# Altium project OPA4377.PrjPCB
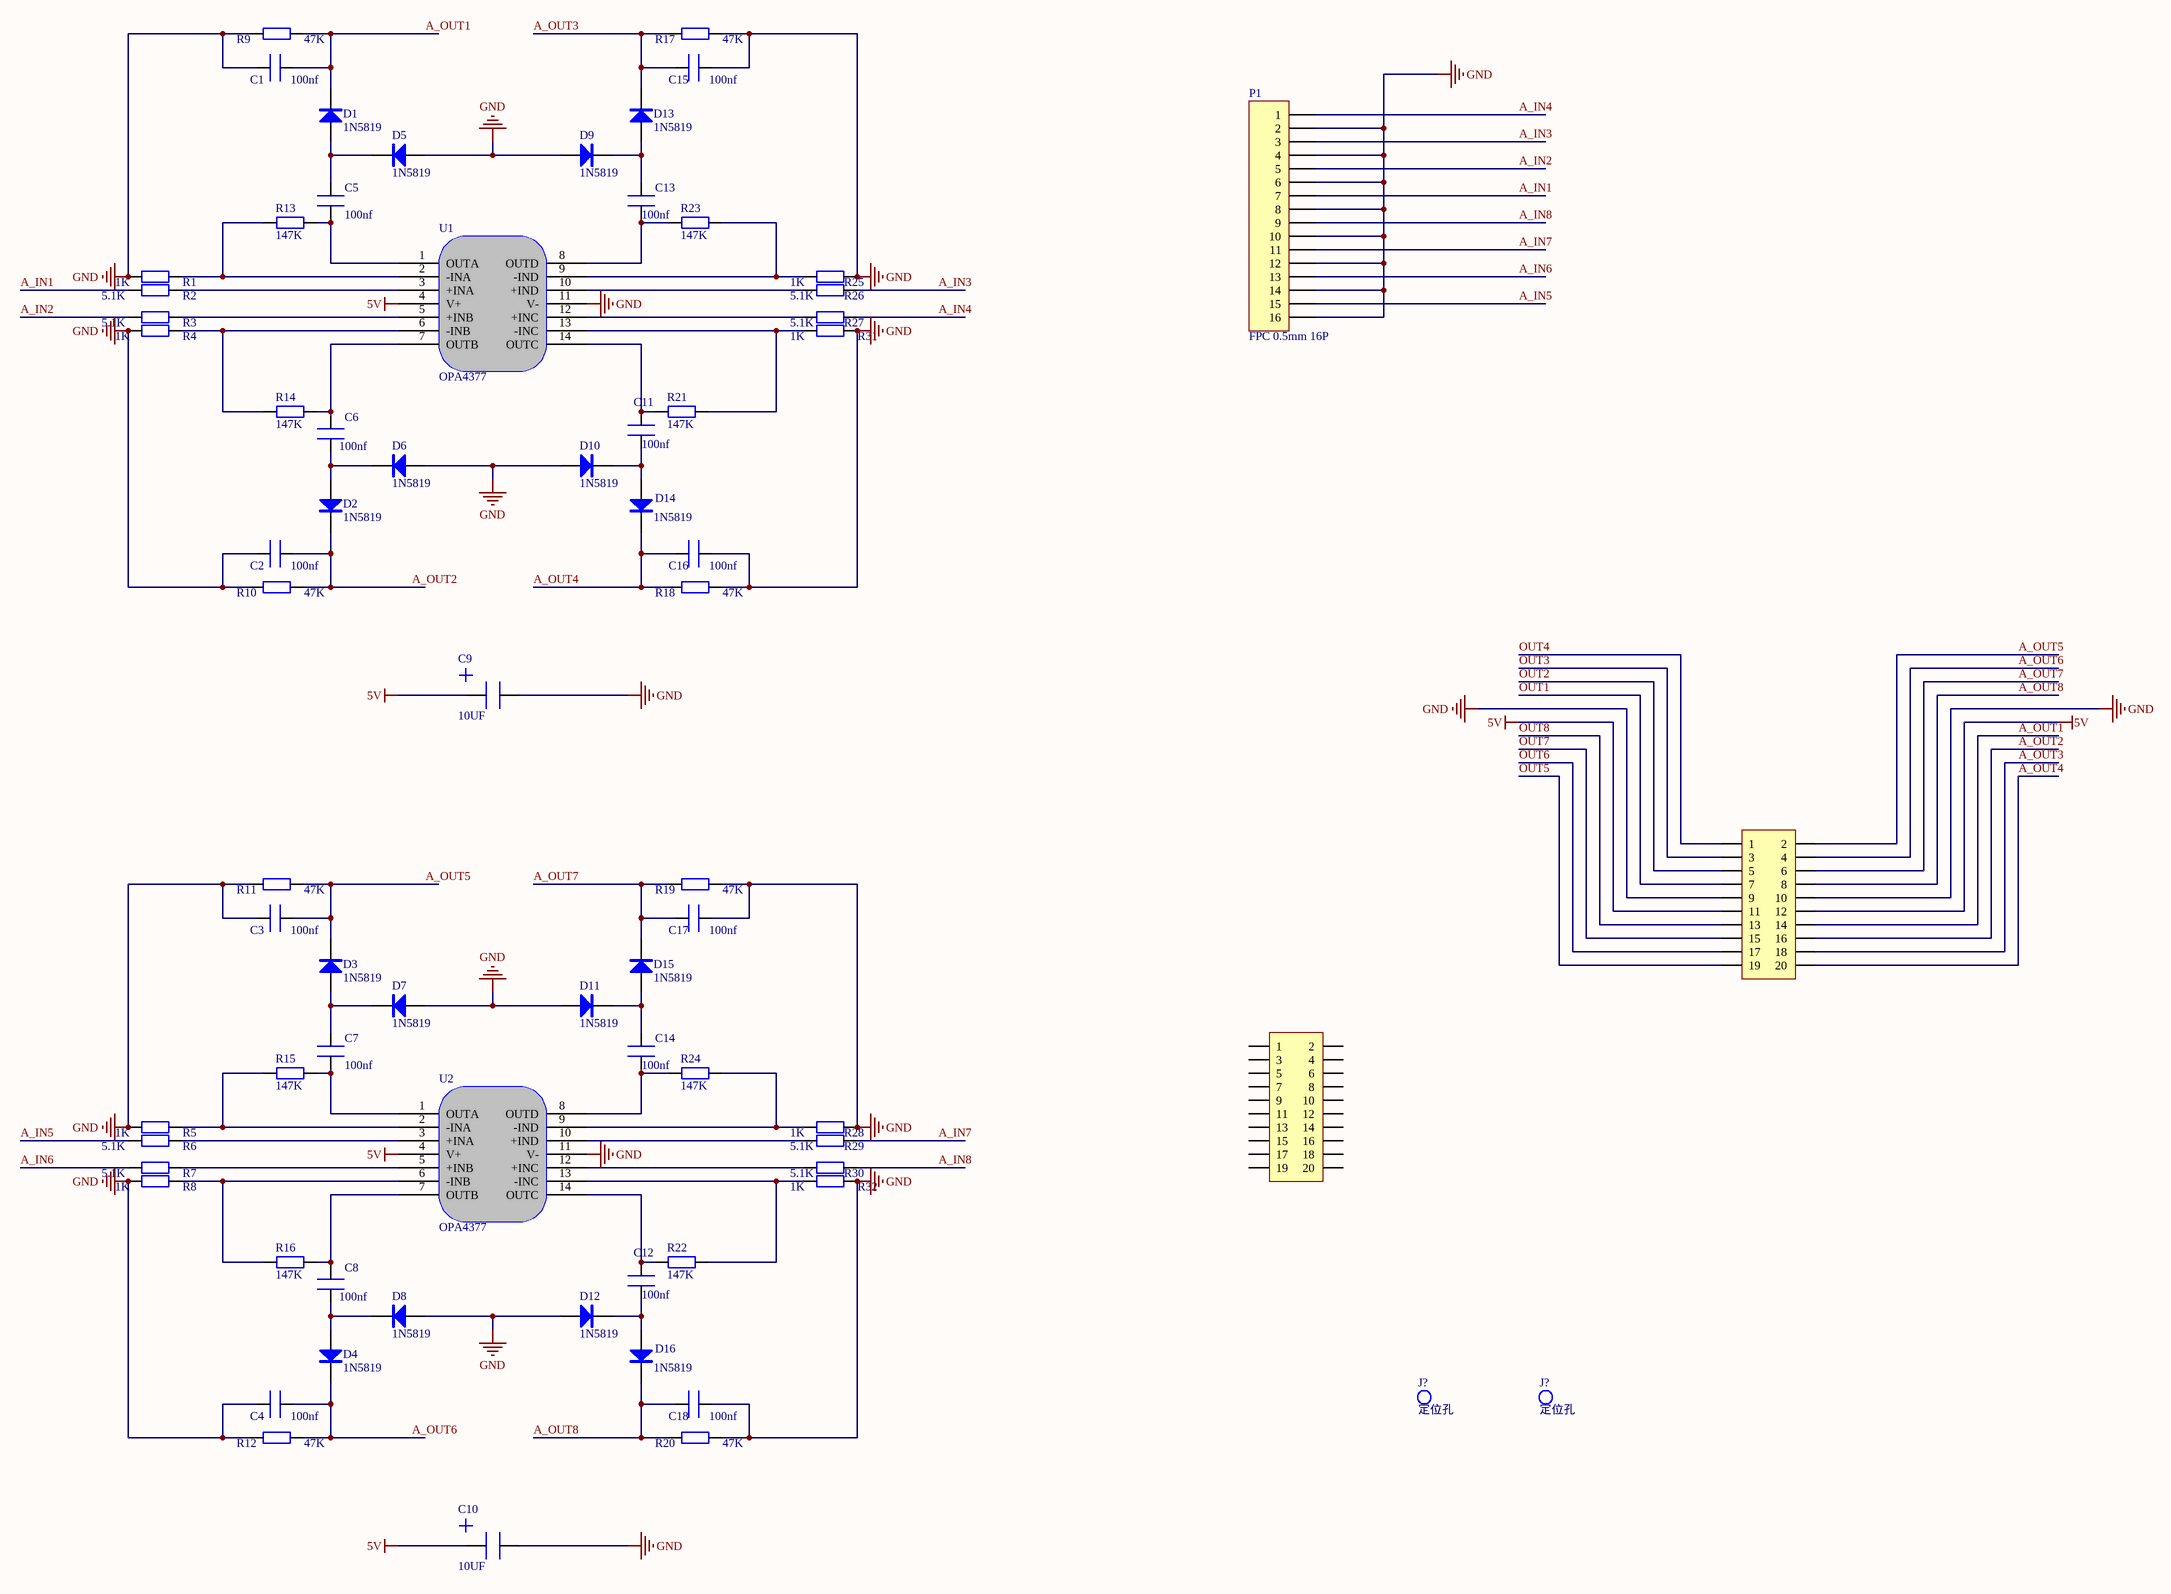
[diagram p0: OPA4377.SchDoc]
2 sheets, 142 parts. Net scope: global (net labels, ports and power ports of the same name join across sheets).
Board files: OPA4377.PcbDoc, OPA4377 - 副本.PcbDoc
Sheets:
  OPA4377.SchDoc
  OPA4377 - 副本.SchDoc

## Sheet OPA4377.SchDoc
size A2

### Parts
(Parts that share a designator on the sheet are numbered #1, #2 ... from top to bottom, then left to right.)
C1  100nf  [C0603]
C2  100nf  [C0603]
C3  100nf  [C0603]
C4  100nf  [C0603]
C5  100nf  [C0603]
C6  100nf  [C0603]
C7  100nf  [C0603]
C8  100nf  [C0603]
C9  10UF  [0805 电容 C3]
C10  10UF  [0805 电容 C3]
C11  100nf  [C0603]
C12  100nf  [C0603]
C13  100nf  [C0603]
C14  100nf  [C0603]
C15  100nf  [C0603]
C16  100nf  [C0603]
C17  100nf  [C0603]
C18  100nf  [C0603]
D1  1N5819  [SOD-523]
D2  1N5819  [SOD-523]
D3  1N5819  [SOD-523]
D4  1N5819  [SOD-523]
D5  1N5819  [SOD-523]
D6  1N5819  [SOD-523]
D7  1N5819  [SOD-523]
D8  1N5819  [SOD-523]
D9  1N5819  [SOD-523]
D10  1N5819  [SOD-523]
D11  1N5819  [SOD-523]
D12  1N5819  [SOD-523]
D13  1N5819  [SOD-523]
D14  1N5819  [SOD-523]
D15  1N5819  [SOD-523]
D16  1N5819  [SOD-523]
J?#1  定位孔  [MTGP720H320V6P - duplicate]
J?#2  定位孔  [MTGP720H320V6P - duplicate]
JP?#1  Header 2X10  [HDR2.54-LI-2x10P]  (value not drawn)
JP?#2  Header 2X10  [HDR2.54-LI-2x10P]  (value not drawn)
P1  FPC 0.5mm 16P  [FPC0.5 2H-WS-16P]
R1  1K  [R0603]
R2  5.1K  [R0603]
R3  5.1K  [R0603]
R4  1K  [R0603]
R5  1K  [R0603]
R6  5.1K  [R0603]
R7  5.1K  [R0603]
R8  1K  [R0603]
R9  47K  [R0603]
R10  47K  [R0603]
R11  47K  [R0603]
R12  47K  [R0603]
R13  147K  [R0603]
R14  147K  [R0603]
R15  147K  [R0603]
R16  147K  [R0603]
R17  47K  [R0603]
R18  47K  [R0603]
R19  47K  [R0603]
R20  47K  [R0603]
R21  147K  [R0603]
R22  147K  [R0603]
R23  147K  [R0603]
R24  147K  [R0603]
R25  1K  [R0603]
R26  5.1K  [R0603]
R27  5.1K  [R0603]
R28  1K  [R0603]
R29  5.1K  [R0603]
R30  5.1K  [R0603]
R31  1K  [R0603]
R32  1K  [R0603]
U1  OPA4377  [TSSOP-14]
U2  OPA4377  [TSSOP-14]

### Nets
5V: C9.1 C10.1 JP?#1.11 JP?#1.12 U1.4(V+) U2.4(V+)
GND: C1.2 C2.2 C3.2 C4.2 C9.2 C10.2 C15.1 C16.1 C17.1 C18.1 D5.1(A) D6.1(A) D7.1(A) D8.1(A) D9.1(A) D10.1(A) D11.1(A) D12.1(A) JP?#1.9 JP?#1.10 P1.2 P1.4 P1.6 P1.8 P1.10 P1.12 P1.14 P1.16 R1.1 R4.1 R5.1 R8.1 R9.1 R10.1 R11.1 R12.1 R17.2 R18.2 R19.2 R20.2 R25.2 R28.2 R31.2 R32.2 U1.11(V-) U2.11(V-)
A_IN1: P1.7 R2.1
A_IN2: P1.5 R3.1
A_IN3: P1.3 R26.2
A_IN4: P1.1 R27.2
A_IN5: P1.15 R6.1
A_IN6: P1.13 R7.1
A_IN7: P1.11 R29.2
A_IN8: P1.9 R30.2
A_OUT1: C1.1 D1.2(K) JP?#1.14 R9.2
A_OUT2: C2.1 D2.2(K) JP?#1.16 R10.2
A_OUT3: C15.2 D13.2(K) JP?#1.18 R17.1
A_OUT4: C16.2 D14.2(K) JP?#1.20 R18.1
A_OUT5: C3.1 D3.2(K) JP?#1.2 R11.2
A_OUT6: C4.1 D4.2(K) JP?#1.4 R12.2
A_OUT7: C17.2 D15.2(K) JP?#1.6 R19.1
A_OUT8: C18.2 D16.2(K) JP?#1.8 R20.1
OUT1: JP?#1.7
OUT2: JP?#1.5
OUT3: JP?#1.3
OUT4: JP?#1.1
OUT5: JP?#1.19
OUT6: JP?#1.17
OUT7: JP?#1.15
OUT8: JP?#1.13
NetC5_1: C5.1 R13.2 U1.1(OUTA)
NetC5_2: C5.2 D1.1(A) D5.2(K)
NetC6_1: C6.1 R14.2 U1.7(OUTB)
NetC6_2: C6.2 D2.1(A) D6.2(K)
NetC7_1: C7.1 R15.2 U2.1(OUTA)
NetC7_2: C7.2 D3.1(A) D7.2(K)
NetC8_1: C8.1 R16.2 U2.7(OUTB)
NetC8_2: C8.2 D4.1(A) D8.2(K)
NetC11_1: C11.1 D10.2(K) D14.1(A)
NetC11_2: C11.2 R21.1 U1.14(OUTC)
NetC12_1: C12.1 D12.2(K) D16.1(A)
NetC12_2: C12.2 R22.1 U2.14(OUTC)
NetC13_1: C13.1 R23.1 U1.8(OUTD)
NetC13_2: C13.2 D9.2(K) D13.1(A)
NetC14_1: C14.1 R24.1 U2.8(OUTD)
NetC14_2: C14.2 D11.2(K) D15.1(A)
NetR1_2: R1.2 R13.1 U1.2(-INA)
NetR2_2: R2.2 U1.3(+INA)
NetR3_2: R3.2 U1.5(+INB)
NetR4_2: R4.2 R14.1 U1.6(-INB)
NetR5_2: R5.2 R15.1 U2.2(-INA)
NetR6_2: R6.2 U2.3(+INA)
NetR7_2: R7.2 U2.5(+INB)
NetR8_2: R8.2 R16.1 U2.6(-INB)
NetR21_2: R21.2 R31.1 U1.13(-INC)
NetR22_2: R22.2 R32.1 U2.13(-INC)
NetR23_2: R23.2 R25.1 U1.9(-IND)
NetR24_2: R24.2 R28.1 U2.9(-IND)
NetR26_1: R26.1 U1.10(+IND)
NetR27_1: R27.1 U1.12(+INC)
NetR29_1: R29.1 U2.10(+IND)
NetR30_1: R30.1 U2.12(+INC)

Not connected (* = marked no-connect by the designer): JP?#2 1 2 3 4 5 6 7 8 9 10 11 12 13 14 15 16 17 18 19 20

### Library data of the parts
C1-C8 C11-C18 = 100nf  0603 C
C9 C10 = TAN C
D1-D16 = 1N5819: 肖特基二极管; 淘宝ID: 黄晶宝石; 属性: 40V/2A; BOM名称: 肖特基二极管; 欢迎光临: https://shop463601444.taobao.com
JP?#1 JP?#2 = Header 10X2: 10*2P接插件; 版权归属: 源创客; BOM名称: 10*2P接插件; 学习资源: www.ooocke.com
P1 = Header 16: Header, 16-Pin; LatestRevisionDate: 17-Jul-2002; LatestRevisionNote: Re-released for DXP Platform.; Publisher: Altium Limited
R1 R4 R5 R8 R25 R28 R31 R32 = 1K 0603 R
R2 R3 R6 R7 R26 R27 R29 R30 = 5.1K 0603 R
R9-R24 = 47K 0603 R

## Sheet OPA4377 - 副本.SchDoc
size A2
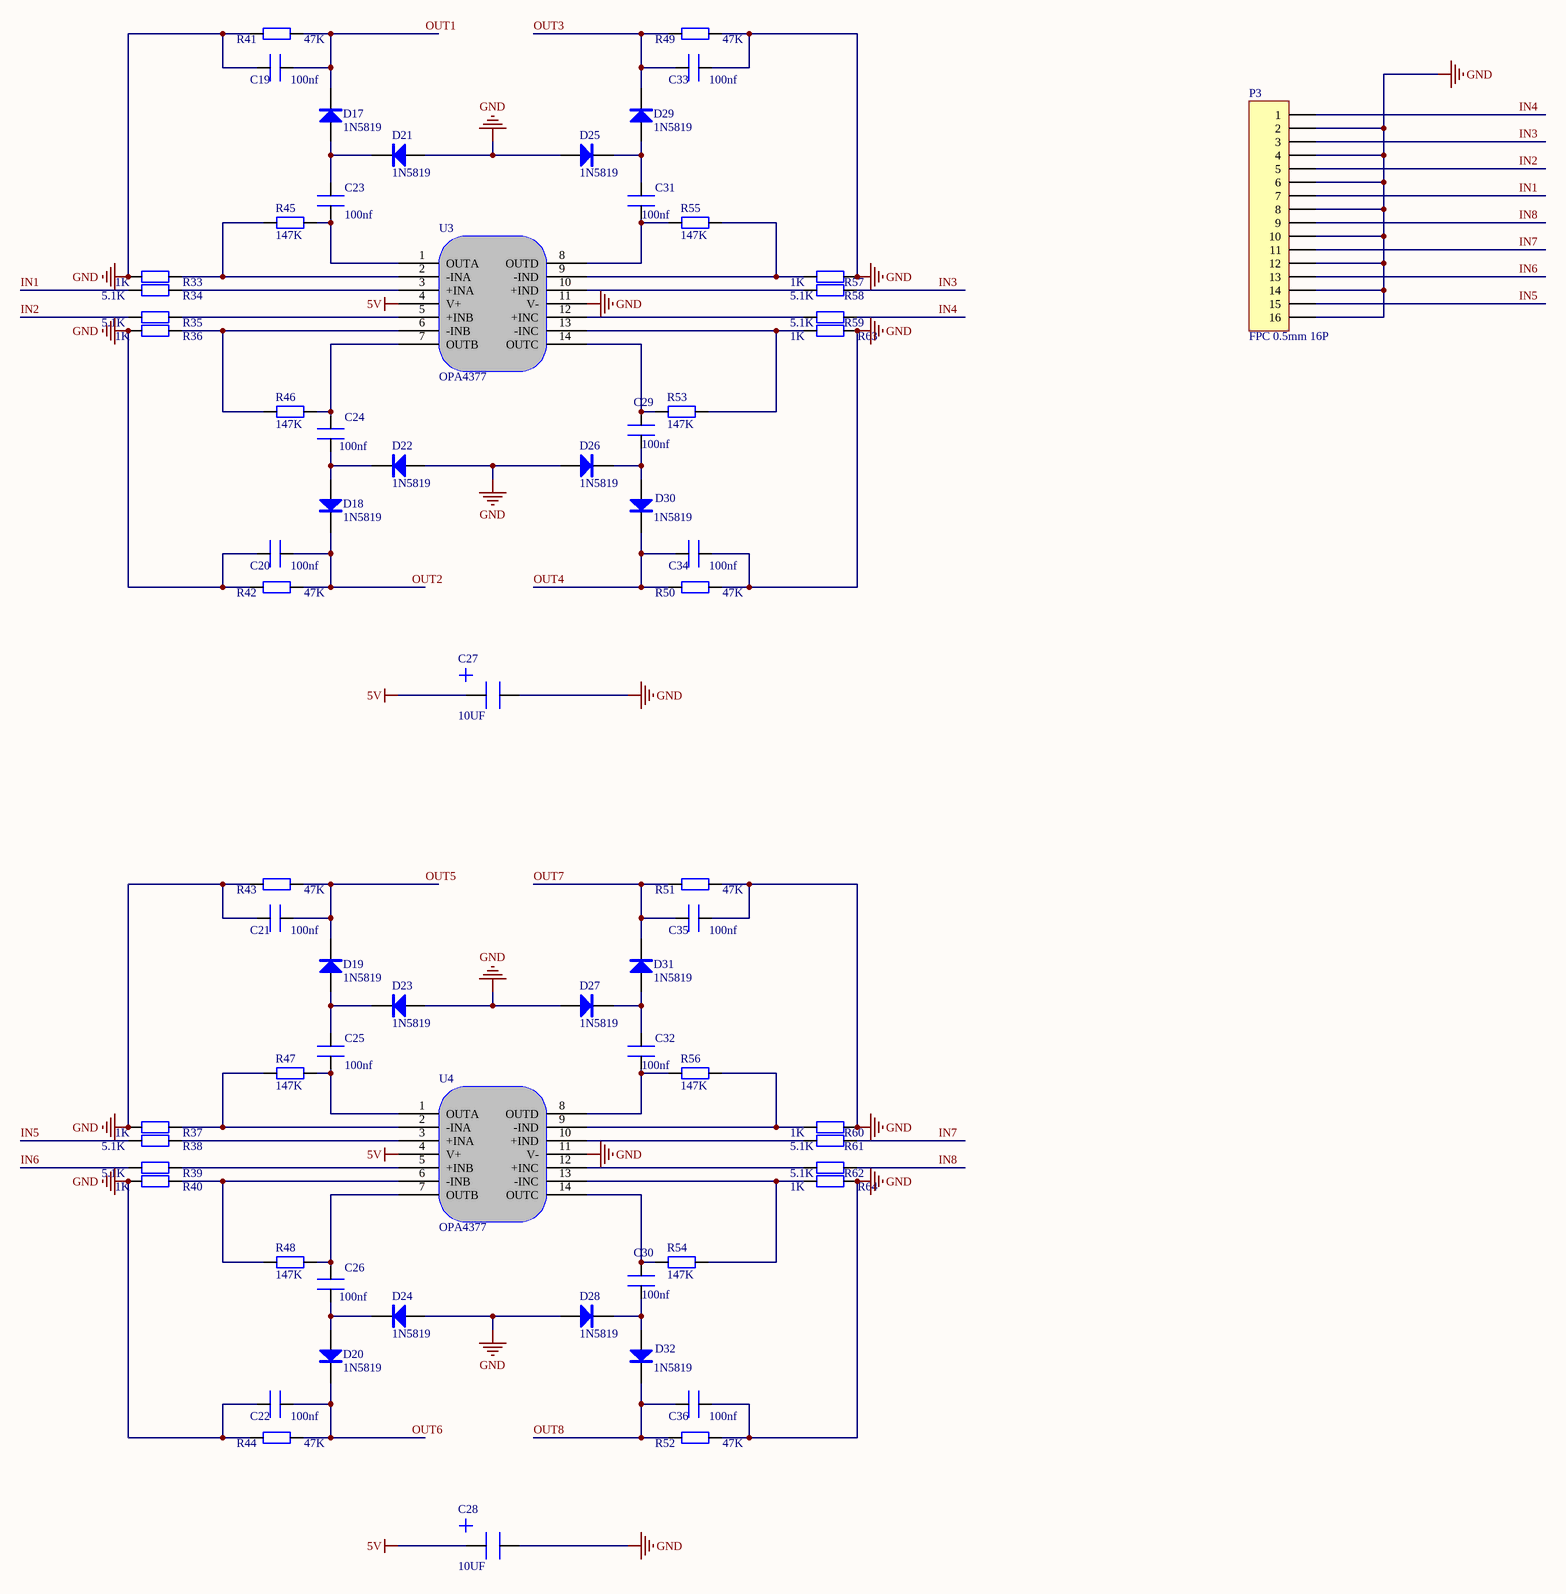
[diagram p1: OPA4377 - 副本.SchDoc]

### Parts
C19  100nf  [C0603]
C20  100nf  [C0603]
C21  100nf  [C0603]
C22  100nf  [C0603]
C23  100nf  [C0603]
C24  100nf  [C0603]
C25  100nf  [C0603]
C26  100nf  [C0603]
C27  10UF  [0805 电容 C3]
C28  10UF  [0805 电容 C3]
C29  100nf  [C0603]
C30  100nf  [C0603]
C31  100nf  [C0603]
C32  100nf  [C0603]
C33  100nf  [C0603]
C34  100nf  [C0603]
C35  100nf  [C0603]
C36  100nf  [C0603]
D17  1N5819  [SOD-523]
D18  1N5819  [SOD-523]
D19  1N5819  [SOD-523]
D20  1N5819  [SOD-523]
D21  1N5819  [SOD-523]
D22  1N5819  [SOD-523]
D23  1N5819  [SOD-523]
D24  1N5819  [SOD-523]
D25  1N5819  [SOD-523]
D26  1N5819  [SOD-523]
D27  1N5819  [SOD-523]
D28  1N5819  [SOD-523]
D29  1N5819  [SOD-523]
D30  1N5819  [SOD-523]
D31  1N5819  [SOD-523]
D32  1N5819  [SOD-523]
P3  FPC 0.5mm 16P  [FPC0.5 2H-WS-16P]
R33  1K  [R0603]
R34  5.1K  [R0603]
R35  5.1K  [R0603]
R36  1K  [R0603]
R37  1K  [R0603]
R38  5.1K  [R0603]
R39  5.1K  [R0603]
R40  1K  [R0603]
R41  47K  [R0603]
R42  47K  [R0603]
R43  47K  [R0603]
R44  47K  [R0603]
R45  147K  [R0603]
R46  147K  [R0603]
R47  147K  [R0603]
R48  147K  [R0603]
R49  47K  [R0603]
R50  47K  [R0603]
R51  47K  [R0603]
R52  47K  [R0603]
R53  147K  [R0603]
R54  147K  [R0603]
R55  147K  [R0603]
R56  147K  [R0603]
R57  1K  [R0603]
R58  5.1K  [R0603]
R59  5.1K  [R0603]
R60  1K  [R0603]
R61  5.1K  [R0603]
R62  5.1K  [R0603]
R63  1K  [R0603]
R64  1K  [R0603]
U3  OPA4377  [TSSOP-14]
U4  OPA4377  [TSSOP-14]

### Nets
5V: C27.1 C28.1 U3.4(V+) U4.4(V+)
GND: C19.2 C20.2 C21.2 C22.2 C27.2 C28.2 C33.1 C34.1 C35.1 C36.1 D21.1(A) D22.1(A) D23.1(A) D24.1(A) D25.1(A) D26.1(A) D27.1(A) D28.1(A) P3.2 P3.4 P3.6 P3.8 P3.10 P3.12 P3.14 P3.16 R33.1 R36.1 R37.1 R40.1 R41.1 R42.1 R43.1 R44.1 R49.2 R50.2 R51.2 R52.2 R57.2 R60.2 R63.2 R64.2 U3.11(V-) U4.11(V-)
IN1: P3.7 R34.1
IN2: P3.5 R35.1
IN3: P3.3 R58.2
IN4: P3.1 R59.2
IN5: P3.15 R38.1
IN6: P3.13 R39.1
IN7: P3.11 R61.2
IN8: P3.9 R62.2
OUT1: C19.1 D17.2(K) R41.2
OUT2: C20.1 D18.2(K) R42.2
OUT3: C33.2 D29.2(K) R49.1
OUT4: C34.2 D30.2(K) R50.1
OUT5: C21.1 D19.2(K) R43.2
OUT6: C22.1 D20.2(K) R44.2
OUT7: C35.2 D31.2(K) R51.1
OUT8: C36.2 D32.2(K) R52.1
NetC23_1: C23.1 R45.2 U3.1(OUTA)
NetC23_2: C23.2 D17.1(A) D21.2(K)
NetC24_1: C24.1 R46.2 U3.7(OUTB)
NetC24_2: C24.2 D18.1(A) D22.2(K)
NetC25_1: C25.1 R47.2 U4.1(OUTA)
NetC25_2: C25.2 D19.1(A) D23.2(K)
NetC26_1: C26.1 R48.2 U4.7(OUTB)
NetC26_2: C26.2 D20.1(A) D24.2(K)
NetC29_1: C29.1 D26.2(K) D30.1(A)
NetC29_2: C29.2 R53.1 U3.14(OUTC)
NetC30_1: C30.1 D28.2(K) D32.1(A)
NetC30_2: C30.2 R54.1 U4.14(OUTC)
NetC31_1: C31.1 R55.1 U3.8(OUTD)
NetC31_2: C31.2 D25.2(K) D29.1(A)
NetC32_1: C32.1 R56.1 U4.8(OUTD)
NetC32_2: C32.2 D27.2(K) D31.1(A)
NetR33_2: R33.2 R45.1 U3.2(-INA)
NetR34_2: R34.2 U3.3(+INA)
NetR35_2: R35.2 U3.5(+INB)
NetR36_2: R36.2 R46.1 U3.6(-INB)
NetR37_2: R37.2 R47.1 U4.2(-INA)
NetR38_2: R38.2 U4.3(+INA)
NetR39_2: R39.2 U4.5(+INB)
NetR40_2: R40.2 R48.1 U4.6(-INB)
NetR53_2: R53.2 R63.1 U3.13(-INC)
NetR54_2: R54.2 R64.1 U4.13(-INC)
NetR55_2: R55.2 R57.1 U3.9(-IND)
NetR56_2: R56.2 R60.1 U4.9(-IND)
NetR58_1: R58.1 U3.10(+IND)
NetR59_1: R59.1 U3.12(+INC)
NetR61_1: R61.1 U4.10(+IND)
NetR62_1: R62.1 U4.12(+INC)

### Library data of the parts
C19-C26 C29-C36 = 100nf  0603 C
C27 C28 = TAN C
D17-D32 = 1N5819: 肖特基二极管; 淘宝ID: 黄晶宝石; 属性: 40V/2A; BOM名称: 肖特基二极管; 欢迎光临: https://shop463601444.taobao.com
P3 = Header 16: Header, 16-Pin; LatestRevisionDate: 17-Jul-2002; LatestRevisionNote: Re-released for DXP Platform.; Publisher: Altium Limited
R33 R36 R37 R40 R57 R60 R63 R64 = 1K 0603 R
R34 R35 R38 R39 R58 R59 R61 R62 = 5.1K 0603 R
R41-R56 = 47K 0603 R

## Nets that join several sheets
5V: OPA4377 (6 pins), OPA4377 - 副本 (C27.1 C28.1 U3.4 U4.4)
GND: OPA4377 (46 pins), OPA4377 - 副本 (44 pins)
OUT1: OPA4377 (JP?#1.7), OPA4377 - 副本 (C19.1 D17.2 R41.2)
OUT2: OPA4377 (JP?#1.5), OPA4377 - 副本 (C20.1 D18.2 R42.2)
OUT3: OPA4377 (JP?#1.3), OPA4377 - 副本 (C33.2 D29.2 R49.1)
OUT4: OPA4377 (JP?#1.1), OPA4377 - 副本 (C34.2 D30.2 R50.1)
OUT5: OPA4377 (JP?#1.19), OPA4377 - 副本 (C21.1 D19.2 R43.2)
OUT6: OPA4377 (JP?#1.17), OPA4377 - 副本 (C22.1 D20.2 R44.2)
OUT7: OPA4377 (JP?#1.15), OPA4377 - 副本 (C35.2 D31.2 R51.1)
OUT8: OPA4377 (JP?#1.13), OPA4377 - 副本 (C36.2 D32.2 R52.1)